# Altium schematic sheet Protect.SchDoc
size A2; SheetNumber: 3; SheetTotal: 7; SPICEModelCacheXTCJCDQW: <root> / <DocumentId>XTCJCDQW</DocumentId> / <CacheFrame Number="0"> / <Model Name="umk107b7474_a-tr" Kind="CKT"> / <Text>* UMK107B7474_A-TR     SPICE MODEL  ( General Type ) / *-------------------------------------------------------------------------------------------------------- / * Model Generated by TAIYO YUDEN Corporation (http://www.ty-top.com) / * Version 1.0 / * TAIYO YUDEN Control No. 170508_110119 / * Copyright(c) 2012 TAIYO YUDEN CO.,LTD. All Rights Reserved. / *-------------------------------------------------------------------------------------------------------- / * / * Products Name : Multilayer Ceramic Capacitors / * / * Characteristics : / *     Capacitance : 0.47 uF , Rated Voltage : 50V , TCC : X7R / *     Case Size : 1.6 x 0.8 / 0.063 x 0.031 [mm/inch] , Thickness : 0.8 / 0.031 [mm/inch] / *     (Conditions: Temperature = 25 degC , DC Bias Current/Voltage = 0A / 0V) / * / * Frequency Range : 40Hz - 3GHz / * / * External Node Assignments : / * / *  1  o---| |---o  2 / * / *-------------------------------------------------------------------------------------------------------- / .SubCkt UMK107B7474_A-TR 1 2 / **************************** / C0 1 110 0.3527u / Cm 1 101 0.045459u / C1 101 102 0.11169u / Rc1 101 102 6.9463k / C2 102 103 0.051734u / Rc2 102 103 650.62 / C3 103 110 0.038139u / Rc3 103 110 34.263 / C2m 1 301 0.059649u / C21 301 302 0.33581u / Rc21 301 302 11.28k / C22 302 303 0.20392u / Rc22 302 303 18.494k / C23 303 304 0.29488u / Rc23 303 304 12.333k / C24 304 305 0.15021u / Rc24 304 305 1.1637k / C25 305 306 0.15017u / Rc25 305 306 1.0968k / C26 306 307 0.081575u / Rc26 306 307 74.316 / C27 307 308 0.067021u / Rc27 307 308 74.754 / C28 308 309 0.05622u / Rc28 308 309 85.848 / C29 309 110 3839.3p / Rc29 309 110 14.414 / Rp0 1 110 1.06382978723404G / L0 110 120 0.25717n / Lm 120 130 0.18418n / L1 120 121 0.16238n / RL1 121 130 0.10645 / L2 120 122 1.5526n / RL2 122 130 1.0028 / L3 120 123 2.68n / RL3 123 130 1.6719 / CR 120 124 0.037577u / LR 124 125 0.31279n / RR 125 130 90.675m / CL 130 140 1.8724p / LL 130 140 0.25802n / RL 130 140 37.565 / Rs 140 2 10.204m / **************************** / .ends UMK107B7474_A-TR</Text> / </Model> / </CacheFrame> / </root>
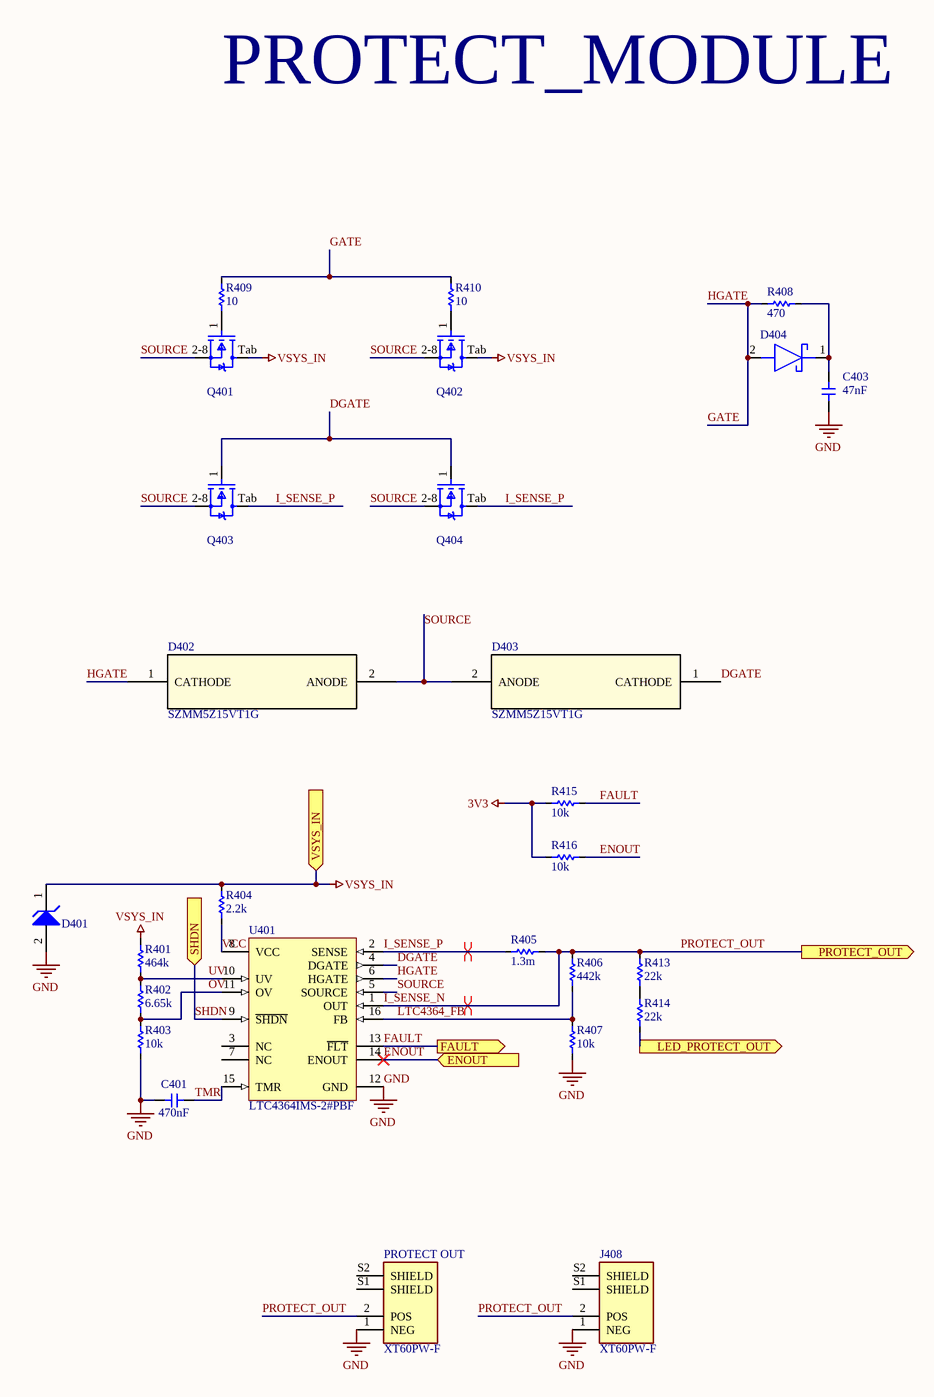
[diagram p0: Protect.SchDoc]

## Parts
C401  Capacitance: 470nF  [C0603]  (hidden comment: C_0603_470NF_10P_50V_X7R)
C403  Capacitance: 47nF  [C0603]  (hidden comment: C_0603_47NF_10P_100V_X7R)
D401  1SMB5945BT3G  [ONSC-SMB-2-403A-03_H_V]  (value not drawn)
D402  SZMM5Z15VT1G  [SOD-523_0P9X1P3_ONS]
D403  SZMM5Z15VT1G  [SOD-523_0P9X1P3_ONS]
D404  SMD110PL-TP  [SODFL3616X135N]  (value not drawn)
J408  XT60PW-F  [XT60PW-F]
PROTECT_OUT  XT60PW-F  [XT60PW-F]
Q401  Trans_Infineon_IPT015N10N5_eec  [Infineon_IPT015N10N5_0]  (value not drawn)
Q402  Trans_Infineon_IPT015N10N5_eec  [Infineon_IPT015N10N5_0]  (value not drawn)
Q403  Trans_Infineon_IPT015N10N5_eec  [Infineon_IPT015N10N5_0]  (value not drawn)
Q404  Trans_Infineon_IPT015N10N5_eec  [Infineon_IPT015N10N5_0]  (value not drawn)
R401  Resistance: 464k  [R0603]  (hidden comment: R_0603_464K_1P_0P1W)
R402  Resistance: 6.65k  [R0603]  (hidden comment: R_0603_6R65K_1P_0P1W)
R403  Resistance: 10k  [R0603]  (hidden comment: R_0603_10K_1P_0P1W)
R404  Resistance: 2.2k  [R2512]  (hidden comment: R_2512_2R2K_1P_2W)
R405  Resistance: 1.3m  [R2512]  (hidden comment: R_2512_1mR3_1P_3W)
R406  Resistance: 442k  [R0603]  (hidden comment: R_0603_442K_1P_0P1W)
R407  Resistance: 10k  [R0603]  (hidden comment: R_0603_10K_1P_0P1W)
R408  Resistance: 470  [R0603]  (hidden comment: R_0603_470R_1P_0P1W)
R409  Resistance: 10  [R0603]  (hidden comment: R_0603_10R_1P_0P1W)
R410  Resistance: 10  [R0603]  (hidden comment: R_0603_10R_1P_0P1W)
R413  Resistance: 22k  [R0603]  (hidden comment: R_0603_22K_1P_0P1W)
R414  Resistance: 22k  [R0603]  (hidden comment: R_0603_22K_1P_0P1W)
R415  Resistance: 10k  [R0603]  (hidden comment: R_0603_10K_1P_0P1W)
R416  Resistance: 10k  [R0603]  (hidden comment: R_0603_10K_1P_0P1W)
U401  LTC4364IMS-2#PBF  [LT-MS-16_M]

## Ports
ENOUT (in, see Control[2B]), FAULT (out, see Control[2B], Connector[2A]), LED_PROTECT_OUT (out, see Control[2B], Debug[2B]), PROTECT_OUT (out, see Control[2A]), SHDN (in, see Control[2B], Connector[2A]), VSYS_IN (in, see Control[1B])

## Nets
3V3: R415.1 R416.1
GND: C401.1 C403.1 D401.2(A) J408.1(NEG) PROTECT_OUT.1(NEG) R403.1 R407.1 U401.12(GND)
VSYS_IN: D401.1(K) Q401.Tab(Drain) Q402.Tab(Drain) R401.2 R404.2 ; port VSYS_IN
DGATE: D403.1(CATHODE) Q403.1(Gate) Q404.1(Gate) U401.4(DGATE)
ENOUT: R416.2 U401.14(ENOUT) ; port ENOUT
FAULT: R415.2 U401.13(~{FLT}) ; port FAULT
GATE: D402.1(CATHODE) D404.2(A) R408.1 R409.2 R410.2 U401.6(HGATE)  [also labelled HGATE]
I_SENSE_N: J408.2(POS) PROTECT_OUT.2(POS) R405.2 R406.2 R413.2 U401.1(OUT) ; port PROTECT_OUT  [also labelled PROTECT_OUT]
I_SENSE_P: Q403.Tab(Drain) Q404.Tab(Drain) R405.1 U401.2(SENSE)
LED_PROTECT_OUT: R414.1 ; port LED_PROTECT_OUT
LTC4364_FB: R406.1 R407.2 U401.16(FB)
OV: R402.1 R403.2 U401.11(OV)
SHDN: U401.9(~{SHDN}) ; port SHDN
SOURCE: D402.2(ANODE) D403.2(ANODE) Q401.2-8(Source) Q402.2-8(Source) Q403.2-8(Source) Q404.2-8(Source) U401.5(SOURCE)
TMR: C401.2 U401.15(TMR)
UV: R401.1 R402.2 U401.10(UV)
VCC: R404.1 U401.8(VCC)
NetC403_2: C403.2 D404.1(K) R408.2
NetQ401_1: Q401.1(Gate) R409.1
NetQ402_1: Q402.1(Gate) R410.1
NetR413_1: R413.1 R414.2

Not connected (* = marked no-connect by the designer): J408 S1(SHIELD) S2(SHIELD); PROTECT_OUT S1(SHIELD) S2(SHIELD); U401 3(NC) 7(NC)

## Layout directives
differential pair: I_SENSE_N, I_SENSE_P

## Notes on the sheet
- PROTECT_MODULE

## Library data of the parts
C401 = CMP-00074-1: MLCC, 470nF, 10%, 50V, X7R, 0603; Voltage Rating: 50V; Dielectric: X7R; Package: 0603; Tolerance: 10%; Mounting Type: SMD
C403 = CMP-00075-1: MLCC, 47nF, 10%, 100V, X7R, 0603; Tolerance: 10%; Package: 0603; Mounting Type: SMD; Dielectric: X7R; Voltage Rating: 100V
D401 = CMP-1060-00175-1: 3 W Zener Voltage Regulator, 2-Pin SMB, Pb-Free, Tape and Reel; Manufacturer: On Semiconductor; VZ Typ (V): 68; ComponentLink3URL: http://www.onsemi.com/pub_link/Collateral/1SMB5913BT3-D.PDF; PackageReference: SMB-2-403A-03_H; PackageDescription: 2-Pin Small Molded Package, J-Bend Lead, Body 4.33 x 3.625 mm; PackageVersion: Rev. H, 05/2011; PartNumber: 1SMB5945BT3G; DatasheetVersion: Rev. 8; ComponentLink1Description: Manufacturer URL; ComponentLink1URL: http://www.onsemi.com/; RoHS: Pb-Free; ComponentLink2Description: Datasheet; Packing: Tape and Reel; ComponentLink2URL: http://www.onsemi.com/pub_link/Collateral/1SMB5913BT3-D.PDF; ComponentLink3Description: Package Specification; Mounting Technology: Surface Mount
D402 D403 = CMP-301-000000-1: Description; Manufacturer_Name: onsemi; RefDes: RefDes; Source: SZMM5Z15VT1G.SchLib; Copyright: Copyright (C) 2025 Ultra Librarian. All rights reserved.; Design Item ID: SZMM5Z15VT1G; Type: Type; Manufacturer_Part_Number: SZMM5Z15VT1G
D404 = SMD110PL-TP: Schottky Diode; Manufacturer_Name: MCC; Datasheet Link: https://www.mccsemi.com/pdf/Products/SMD15PL-SMD1200PL(SOD-123FL).pdf; Height: 1.35mm; Manufacturer_Part_Number: SMD110PL-TP; Mouser Part Number: 833-SMD110PL-TP; Mouser Price/Stock: https://www.mouser.co.uk/ProductDetail/Micro-Commercial-Components-MCC/SMD110PL-TP?qs=xjxbgUsuSIBtRX%252BtbqnRwQ%3D%3D; Arrow Part Number: SMD110PL-TP; Arrow Price/Stock: https://www.arrow.com/en/products/smd110pl-tp/micro-commercial-components?utm_currency=USD&region=europe
J408 PROTECT_OUT = CMP-019-000058-2: Socket DC Supply Connector Female; MF: AMASS; Price: None; Value: *; Package: Package; Check_prices: https://www.snapeda.com/parts/XT60PW-F/AMASS/view-part/?ref=eda; Design Item ID: XT60PW-F; SnapEDA_Link: https://www.snapeda.com/parts/XT60PW-F/AMASS/view-part/?ref=snap; MP: XT60PW-F; Availability: Not in stock; System: Connector; Source: robit_connector.SchLib
Q401-Q404 = Trans_Infineon_IPT015N10N5_eec: TRANS MOSFET N-CH 100V 300A 8HSOF; Part Number: IPT015N10N5; helpURL: https://upverter.com/upn/revision/59ddb1136ed40b7f/; ComponentLink2Description: Datasheet; Temperature: -55°C to +175°C; Package: HSOF8; Supplier 2: Mouser; Supplier 1: Digi-Key; ComponentLink1URL: https://upverter.com/upn/revision/59ddb1136ed40b7f/; Supplier Part Number 2: 726-IPT015N10N5ATMA1; Supplier Part Number 1: IPT015N10N5ATMA1CT-ND; Manufacturer: Infineon; ComponentLink1Description: Upverter; ComponentLink2URL: http://www.infineon.com/dgdl/Infineon-IPT015N10N5-DS-v02_02-EN.pdf?fileId=5546d4624a75e5f1014ac94680661aff; RoHS: TRUE; Mouser Part Number: 726-IPT015N10N5ATMA1; Temperature Range High: +175°C; Digikey Description: TRANS MOSFET N-CH 100V 300A 8HSOF; Digikey Part Number: IPT015N10N5ATMA1CT-ND; Lead Free: yes; Temperature Range Low: -55°C
R401 = CMP-00067-2: Chip resistor, 464k Ohm, 1%, 0.1W, 0603; Voltage Rating: 75V; Power Rating: 100mW; Mounting Type: SMD; Package: 0603; Tolerance: 1%
R402 = CMP-00068-1: Chip resistor, 6.65k Ohm, 1%, 0.1W, 0603; Power Rating: 100mW; Voltage Rating: 75V; Package: 0603; Mounting Type: SMD; Tolerance: 1%
R403 R407 R415 R416 = CMP-00032-1: Chip resistor, 10k Ohm, 1%, 0.1W, 0603; Power Rating: 100mW; Voltage Rating: 75V; Package: 0603; Mounting Type: SMD; Tolerance: 1%
R404 = CMP-00066-1: Chip resistor, 2.2k Ohm, ±1%, 2W, 2512; Tolerance: 1%; Package: 2512; Mounting Type: SMD; Power Rating: 2W
R405 = CMP-00073-2: Chip resistor, 1.3m Ohm, ±1%, 3W, 2512; Tolerance: 1%; Mounting Type: SMD; Package: 2512; Power Rating: 3W
R406 = CMP-00070-1: Chip resistor, 442k Ohm, 1%, 0.1W, 0603; Power Rating: 100mW; Voltage Rating: 75V; Mounting Type: SMD; Package: 0603; Tolerance: 1%
R408 = CMP-00069-1: Chip resistor, 470 Ohm, 1%, 0.1W, 0603; Voltage Rating: 75V; Power Rating: 100mW; Tolerance: 1%; Mounting Type: SMD; Package: 0603
R409 R410 = CMP-00010-8: Chip resistor, 10 Ohm, 1%, 0.1W, 0603; Power Rating: 100mW; Voltage Rating: 50V; Package: 0603; Mounting Type: SMD; Tolerance: 1%
R413 R414 = CMP-00064-1: Chip resistor, 22k Ohm, 1%, 0.1W, 0603; Power Rating: 100mW; Voltage Rating: 75V; Tolerance: 1%; Mounting Type: SMD; Package: 0603
U401 = CMP-0474-00539-1: Surge Stopper with Ideal Diode, 4 to 80 V Vin, 16-pin SOP (MS-16), -40 to 85 degC, Pb-Free; Manufacturer: Linear Technology; Fast Comparator: no; Circuit Breaker Threshold: 50 mV; Circuit Breakers(#): 1; Active Limiting: yes; Vin Range: 4 to 80 V; Circuit Breaker Accuracy(%): 10; Extended Temp: C, I, H; ComponentLink1Description: Manufacturer URL; PackageReference: MS16; Mounting Technology: Surface Mount; RoHS: TRUE; PackageDescription: 16-Pin Plastic MSOP, Body 4.04 x 3.00 mm, Pitch 0.50 mm; ComponentLink3Description: Package Specification; PartNumber: LTC4364IMS-2#PBF; Power Good: no; ComponentLink2Description: Datasheet; ComponentLink2URL: http://cds.linear.com/docs/en/datasheet/436412f.pdf; ComponentLink1URL: http://www.linear.com/; ComponentLink3URL: http://cds.linear.com/docs/en/packaging/05081669_A_MS16.pdf; PackageVersion: Rev. Ã˜, 06/2010